# Altium schematic sheet Extended_design_unvalidated.SchDoc (part 3 of 3)
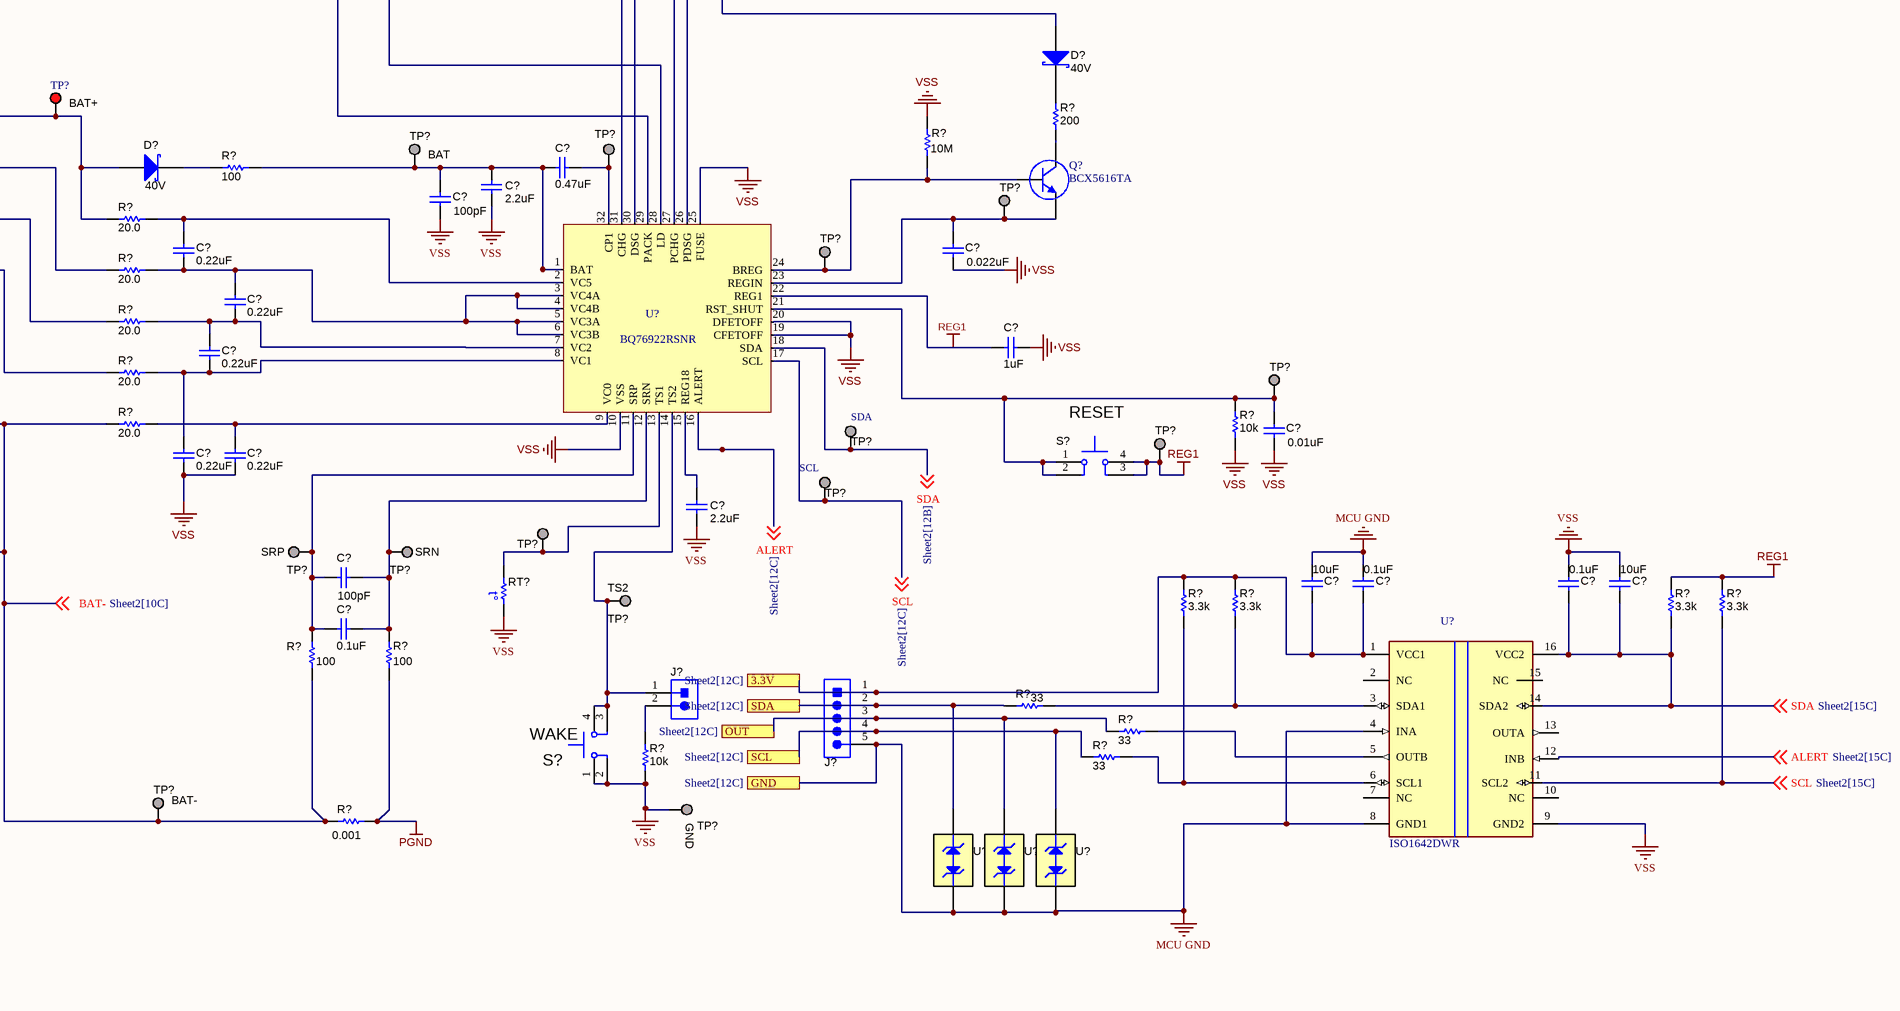
[diagram p5: Extended_design_unvalidated.SchDoc, bottom right]

## Library data of the parts (continued)
U?#3 U?#4 = CMP-0043093-3: Single-Channel ESD in 0402 Package With 10pF Capacitance and 6V Breakdown, DPY0002A (X1SON-2); Manufacturer: Texas Instruments; Alternate PartNumber: TPD1E10B06DPYT; IEC 61000-4-2 Air-Gap(+/- kV): 30; Eco-Plan: TBD; IO Capacitance(Typ)(pF): 10; Breakdown Voltage(Min)(V): 6; AEC Category: Q200; AEC Qualified: N; CompType: IC; Green_Lifecycle: Active; Green_REACh: Passed; SizeAreaWB_mm2: 3.2; SizeArea_mm2: 0.6; SizeX_mm: 1.0; SizeZ_mm: 0.45; Rating: Catalog; ComponentLink3Description: Online Datasheet; PackageReference: DPY0002A; PackageDescription: X1SON-2; ComponentLink2URL: http://www.ti.com/product/tpd1e10b06; ComponentLink1URL: http://www.ti.com/lit/ds/symlink/tpd1e10b06.pdf; ComponentLink3URL: http://www.ti.com/product/tpd1e10b06/datasheet; IO Leakage Current(nA): 10; ComponentLink1Description: Datasheet Link; ComponentLink2Description: Product Folder; PartNumber: TPD1E10B06DPYR; IEC 61000-4-2 Contact(+/- kV): 30; Alternate Manufacturer: Texas Instruments; Green_EU RoHS: Passed; Green_EU RoHS-2: Passed; MountType: SMT; RoHS: Y; SizeY_mm: 0.6; Operating Temperature Range: -40 to 125 C
U?#5 = CMP-031-00009-2: Hot-swappable, robust-EMC bidirectional I²C Isolators with 2 GPIOs 16-SOIC -40 to 125; Manufacturer Lifecycle Status: ACTIVE; Max Junction Temperature (Tj): 150°C; Max Supply Voltage: 5.5V; Min Supply Voltage: 2.25V; Interface: I2C; Width: 7.5mm; Height: 2.65mm; RoHS: Compliant; Case/Package: SOIC; Max Operating Temperature: 125°C; Length: 10.3mm; Min Operating Temperature: -40°C; Lifecycle Status: Production; Thickness: 2.35mm; Pins: 16
U?#6-U?#8 = CMP-0043093-3: Single-Channel ESD in 0402 Package With 1pF Capacitance and 6V Breakdown, DPY0002A (X1SON-2); Manufacturer: Texas Instruments; PartNumber: TPD1E10B06DPYR; Alternate PartNumber: TPD1E10B06DPYT; IEC 61000-4-2 Air-Gap(+/- kV): 30; Eco-Plan: TBD; IO Capacitance(Typ)(pF): 10; Breakdown Voltage(Min)(V): 6; AEC Category: Q200; AEC Qualified: N; CompType: IC; Green_Lifecycle: Active; Green_REACh: Passed; SizeAreaWB_mm2: 3.2; SizeArea_mm2: 0.6; SizeX_mm: 1.0; SizeZ_mm: 0.45; Rating: Catalog; ComponentLink3Description: Online Datasheet; PackageReference: DPY0002A; PackageDescription: X1SON-2; ComponentLink2URL: http://www.ti.com/product/tpd1e10b06; ComponentLink1URL: http://www.ti.com/lit/ds/symlink/tpd1e10b06.pdf; ComponentLink3URL: http://www.ti.com/product/tpd1e10b06/datasheet; IO Leakage Current(nA): 10; ComponentLink1Description: Datasheet Link; ComponentLink2Description: Product Folder; IEC 61000-4-2 Contact(+/- kV): 30; Alternate Manufacturer: Texas Instruments; Green_EU RoHS: Passed; Green_EU RoHS-2: Passed; MountType: SMT; RoHS: Y; SizeY_mm: 0.6; Operating Temperature Range: -40 to 125 C
U?#9 = CMP-019-00050-1: IC REG BUCK ADJ 1A SOT23-6 Buck Switching Regulator IC Positive Adjustable 1V 1 Output 1A SOT-23-6; Manufacturer Lifecycle Status: ACTIVE; Min Supply Voltage: 4V; Max Junction Temperature (Tj): 150°C; Switching Frequency: 700kHz; Nominal Supply Current: 80µA; Number of Channels: 1; Max Supply Voltage: 36V; Max Duty Cycle: 98%; Length: 2.9mm; Case/Package: SOT-23; Width: 1.6mm; Min Operating Temperature: -40°C; Height: 0m; Pins: 6; Schedule B: 8542390000; Lifecycle Status: Production; Topology: Buck; Output Current: 1A; Number of Outputs: 1; Max Operating Temperature: 150°C; RoHS: Compliant; Thickness: 1.2mm